# Altium schematic sheet Sheet1.SchDoc
size A2 portrait; Organization: Altium Limited; Address1: L3, 12a Rodborough Rd; Address2: Frenchs Forest; Address3: NSW; Address4: Australia 2086
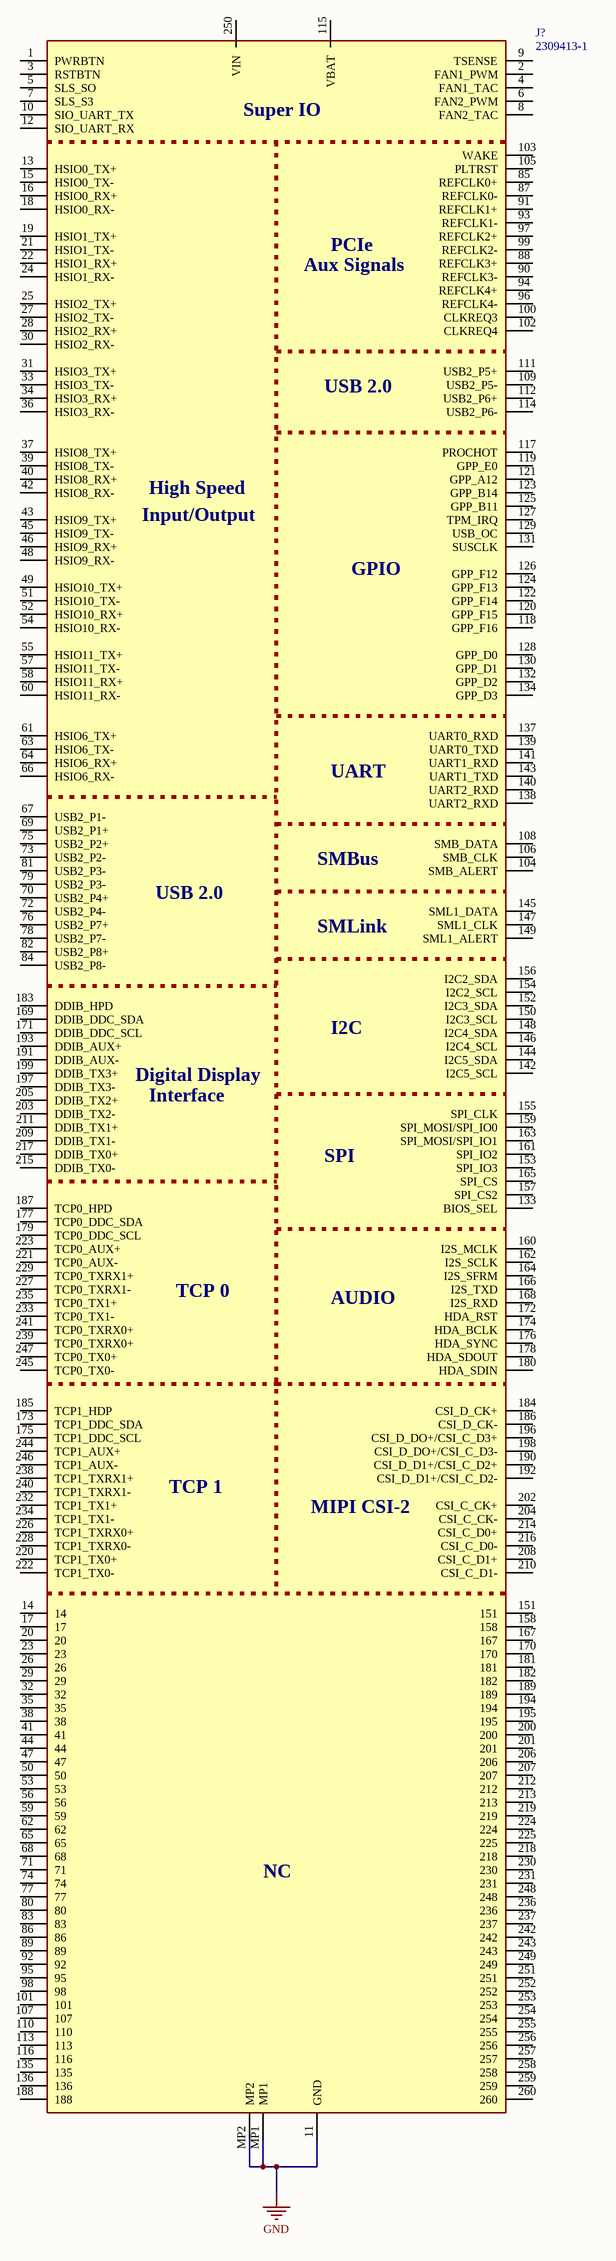
[diagram p0: Sheet1.SchDoc]

## Parts
J?  2309413-1  [23094131]

## Nets
GND: J?.11(GND) J?.MP1 J?.MP2

Not connected (* = marked no-connect by the designer): J? 1(PWRBTN) 2(FAN1_PWM) 3(RSTBTN) 4(FAN1_TAC) 5(SLS_SO) 6(FAN2_PWM) 7(SLS_S3) 8(FAN2_TAC) 9(TSENSE) 10(SIO_UART_TX) 12(SIO_UART_RX) 13(HSIO0_TX+) 14 15(HSIO0_TX-) 16(HSIO0_RX+) 17 18(HSIO0_RX-) 19(HSIO1_TX+) 20 21(HSIO1_TX-) 22(HSIO1_RX+) 23 24(HSIO1_RX-) 25(HSIO2_TX+) 26 27(HSIO2_TX-) 28(HSIO2_RX+) 29 30(HSIO2_RX-) 31(HSIO3_TX+) 32 33(HSIO3_TX-) 34(HSIO3_RX+) 35 36(HSIO3_RX-) 37(HSIO8_TX+) 38 39(HSIO8_TX-) 40(HSIO8_RX+) 41 42(HSIO8_RX-) 43(HSIO9_TX+) 44 45(HSIO9_TX-) 46(HSIO9_RX+) 47 48(HSIO9_RX-) 49(HSIO10_TX+) 50 51(HSIO10_TX-) 52(HSIO10_RX+) 53 54(HSIO10_RX-) 55(HSIO11_TX+) 56 57(HSIO11_TX-) 58(HSIO11_RX+) 59 60(HSIO11_RX-) 61(HSIO6_TX+) 62 63(HSIO6_TX-) 64(HSIO6_RX+) 65 66(HSIO6_RX-) 67(USB2_P1-) 68 69(USB2_P1+) 70(USB2_P4+) 71 72(USB2_P4-) 73(USB2_P2-) 74 75(USB2_P2+) 76(USB2_P7+) 77 78(USB2_P7-) 79(USB2_P3-) 80 81(USB2_P3-) 82(USB2_P8+) 83 84(USB2_P8-) 85(REFCLK0+) 86 87(REFCLK0-) 88(REFCLK3+) 89 90(REFCLK3-) 91(REFCLK1+) 92 93(REFCLK1-) 94(REFCLK4+) 95 96(REFCLK4-) 97(REFCLK2+) 98 99(REFCLK2-) 100(CLKREQ3) 101 102(CLKREQ4) 103(WAKE) 104(SMB_ALERT) 105(PLTRST) 106(SMB_CLK) 107 108(SMB_DATA) 109(USB2_P5-) 110 111(USB2_P5+) 112(USB2_P6+) 113 114(USB2_P6-) 115(VBAT) 116 117(PROCHOT) 118(GPP_F16) 119(GPP_E0) 120(GPP_F15) 121(GPP_A12) 122(GPP_F14) 123(GPP_B14) 124(GPP_F13) 125(GPP_B11) 126(GPP_F12) 127(TPM_IRQ) 128(GPP_D0) 129(USB_OC) 130(GPP_D1) 131(SUSCLK) 132(GPP_D2) 133(BIOS_SEL) 134(GPP_D3) 135 136 137(UART0_RXD) 138(UART2_RXD) 139(UART0_TXD) 140(UART2_RXD) 141(UART1_RXD) 142(I2C5_SCL) 143(UART1_TXD) 144(I2C5_SDA) 145(SML1_DATA) 146(I2C4_SCL) 147(SML1_CLK) 148(I2C4_SDA) 149(SML1_ALERT) 150(I2C3_SCL) 151 152(I2C3_SDA) 153(SPI_IO3) 154(I2C2_SCL) 155(SPI_CLK) 156(I2C2_SDA) 157(SPI_CS2) 158 159(SPI_MOSI/SPI_IO0) 160(I2S_MCLK) 161(SPI_IO2) 162(I2S_SCLK) 163(SPI_MOSI/SPI_IO1) 164(I2S_SFRM) 165(SPI_CS) 166(I2S_TXD) 167 168(I2S_RXD) 169(DDIB_DDC_SDA) 170 171(DDIB_DDC_SCL) 172(HDA_RST) 173(TCP1_DDC_SDA) 174(HDA_BCLK) 175(TCP1_DDC_SCL) 176(HDA_SYNC) 177(TCP0_DDC_SDA) 178(HDA_SDOUT) 179(TCP0_DDC_SCL) 180(HDA_SDIN) 181 182 183(DDIB_HPD) 184(CSI_D_CK+) 185(TCP1_HDP) 186(CSI_D_CK-) 187(TCP0_HPD) 188 189 190(CSI_D_D1+/CSI_C_D2+) 191(DDIB_AUX-) 192(CSI_D_D1+/CSI_C_D2-) 193(DDIB_AUX+) 194 195 196(CSI_D_DO+/CSI_C_D3+) 197(DDIB_TX3-) 198(CSI_D_DO+/CSI_C_D3-) 199(DDIB_TX3+) 200 201 202(CSI_C_CK+) 203(DDIB_TX2-) 204(CSI_C_CK-) 205(DDIB_TX2+) 206 207 208(CSI_C_D1+) 209(DDIB_TX1-) 210(CSI_C_D1-) 211(DDIB_TX1+) 212 213 214(CSI_C_D0+) 215(DDIB_TX0-) 216(CSI_C_D0-) 217(DDIB_TX0+) 218 219 220(TCP1_TX0+) 221(TCP0_AUX-) 222(TCP1_TX0-) 223(TCP0_AUX+) 224 225 226(TCP1_TXRX0+) 227(TCP0_TXRX1-) 228(TCP1_TXRX0-) 229(TCP0_TXRX1+) 230 231 232(TCP1_TX1+) 233(TCP0_TX1-) 234(TCP1_TX1-) 235(TCP0_TX1+) 236 237 238(TCP1_TXRX1+) 239(TCP0_TXRX0+) 240(TCP1_TXRX1-) 241(TCP0_TXRX0+) 242 243 244(TCP1_AUX+) 245(TCP0_TX0-) 246(TCP1_AUX-) 247(TCP0_TX0+) 248 249 250(VIN) 251 252 253 254 255 256 257 258 259 260

## Notes on the sheet
- Title
- Size:
- Date:
- File:
- A2
- Number:
- Time:
- Revision:
- Sheet
- of
- (in symbol 2309413-1) Super IO; PCIe; Aux Signals; USB 2.0; High Speed; Input/Output; GPIO; UART; SMBus; SMLink; I2C; Digital Display; Interface; SPI; TCP 0; AUDIO; TCP 1; MIPI CSI-2; NC

## Library data of the parts
J? = 2309413-1: Body Features: Module Key Type Offset Left; Manufacturer_Name: TE Connectivity; Geometry.Height: 9.45mm; Mouser Part Number: 571-2309413-1; Mouser Price/Stock: https://www.mouser.co.uk/ProductDetail/TE-Connectivity/2309413-1?qs=1mbolxNpo8ckNkoYMswDaw%3D%3D; Manufacturer_Part_Number: 2309413-1; Datasheet Link: https://www.te.com/commerce/DocumentDelivery/DDEController?Action=showdoc&DocId=Customer+Drawing%7F2309413%7F3%7Fpdf%7FEnglish%7FENG_CD_2309413_3.pdf%7F2309413-1